# Altium schematic sheet Core.SchDoc
size A; SheetNumber: 1; SheetTotal: 3
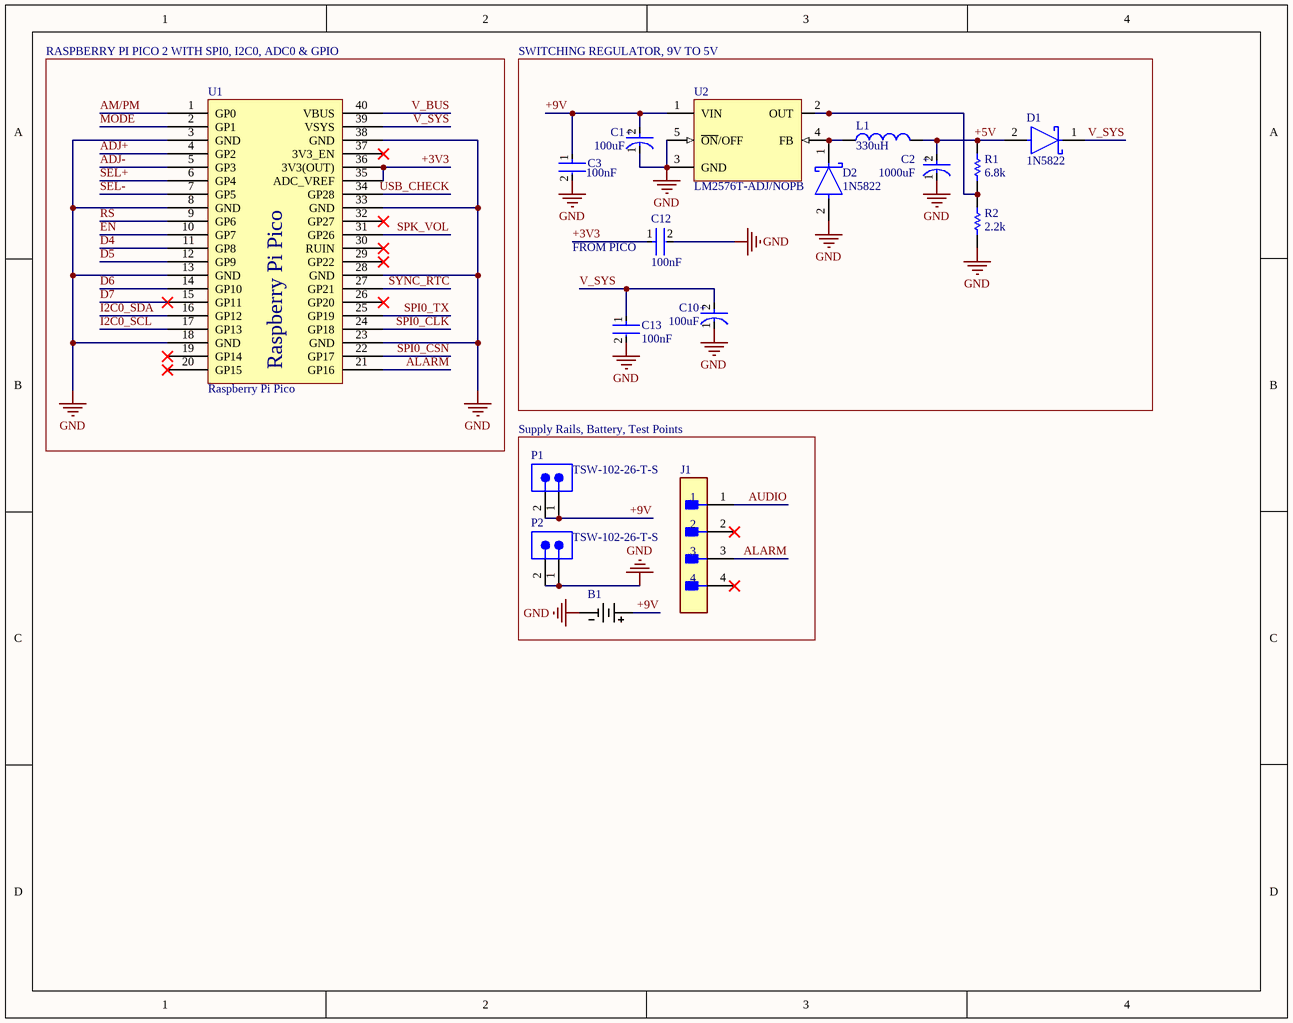
[diagram p0: Core.SchDoc]

## Parts
B1  BC9VPC  [BC9VPC_MPD]  (value not drawn)
C1  Capacitance: 100uF  [FP-RAD-TH-D_6_3_0_5-L_11-MFG]  (hidden comment: EEUFM1E101B)
C2  value 1000uF  [FP-RAD-TH-D_12_5_0_5-L_20-MFG]  (hidden comment: EEUFP1V102B)
C3  Capacitance: 100nF  [FP-RDE3M1-MFG]  (hidden comment: RDED72W104K3K1H03B)
C10  Capacitance: 100uF  [FP-RAD-TH-D_6_3_0_5-L_11-MFG]  (hidden comment: EEUFM1E101B)
C12  Capacitance: 100nF  [FP-RDE3M1-MFG]  (hidden comment: RDED72W104K3K1H03B)
C13  Capacitance: 100nF  [FP-RDE3M1-MFG]  (hidden comment: RDED72W104K3K1H03B)
D1  1N5822  [FP-DO-201AD-MFG]
D2  1N5822  [FP-DO-201AD-MFG]
J1  TSW-104-23-T-S  [FP-TSW-104-23-T-S-MFG]  (value not drawn)
L1  value 330uH  [SPD73R-334M]  (hidden comment: Inductor)
P1  TSW-102-26-T-S  [SMTC-TSW-102-26-XX-S]
P2  TSW-102-26-T-S  [SMTC-TSW-102-26-XX-S]
R1  Resistance: 6.8k  [RESA60-630X240]  (hidden comment: MFR-25FBF52-1M)
R2  Resistance: 2.2k  [RESA60-630X240]  (hidden comment: MFR-25FBF52-1M)
U1  Raspberry Pi Pico  [Raspberry Pi Pico]
U2  LM2576T-ADJ/NOPB  [KC0005A]

## Blocks framed on the sheet
RASPBERRY PI PICO 2 WITH SPI0, I2C0, ADC0 & GPIO: U1
Supply Rails, Battery, Test Points: B1 J1 P1 P2

## Nets
GND: B1.2 C1.1(C) C2.1(C) C3.2 C10.1(C) C12.2 C13.2 D2.2(A) P2.1 P2.2 R2.1 U1.3(GND) U1.8(GND) U1.13(GND) U1.18(GND) U1.23(GND) U1.28(GND) U1.33(GND) U1.38(GND) U2.3(GND) U2.5(~{ON}/OFF)
+3V3: C12.1 U1.35(ADC_VREF) U1.36(3V3(OUT))
+5V: C2.2(A) D1.2(A) L1.2 R1.2
+9V: B1.1 C1.2(A) C3.1 P1.1 P1.2 U2.1(VIN)
ADJ+: U1.4(GP2)
ADJ-: U1.5(GP3)
ALARM: J1.3 U1.21(GP16)
AM/PM: U1.1(GP0)
AUDIO: J1.1
D4: U1.11(GP8)
D5: U1.12(GP9)
D6: U1.14(GP10)
D7: U1.15(GP11)
EN: U1.10(GP7)
I2C0_SCL: U1.17(GP13)
I2C0_SDA: U1.16(GP12)
MODE: U1.2(GP1)
RS: U1.9(GP6)
SEL+: U1.6(GP4)
SEL-: U1.7(GP5)
SPI0_CLK: U1.24(GP18)
SPI0_CSN: U1.22(GP17)
SPI0_TX: U1.25(GP19)
SPK_VOL: U1.31(GP26)
SYNC_RTC: U1.27(GP21)
USB_CHECK: U1.34(GP28)
V_BUS: U1.40(VBUS)
V_SYS: C10.2(A) C13.1 D1.1(C) U1.39(VSYS)
NetD2_1: D2.1(C) L1.1 U2.4(FB)
NetR1_1: R1.1 R2.2 U2.2(OUT)

Not connected (* = marked no-connect by the designer): J1 2* 4*; U1 19(GP14)* 20(GP15)* 26(GP20)* 29(GP22)* 30(RUIN)* 32(GP27)* 37(3V3_EN)*

## Notes on the sheet
- SWITCHING REGULATOR, 9V TO 5V
- (near C12) FROM PICO
- (in symbol CMP-05427-000856-1) +
- (in symbol CMP-05427-001378-1) +

## Library data of the parts
B1 = BC9VPC: Description; Manufacturer_Name: Memory Protection Devices; Copyright: Copyright (C) 2026 Ultra Librarian. All rights reserved.; Manufacturer_Part_Number: BC9VPC
C1 C10 = CMP-05427-000856-1: Aluminum Electrolytic Capacitors (Radial Lead Type) 100uF ±20% 25V; Lead Diameter: 0.5mm; Polarity: Polar; Ripple Current: 455mA; Impedance: 130mR; Life (Hours): 2000Hour; Length: 11mm; Min Operating Temperature: -40°C; Termination: Radial; Diameter: 6mm; Lead Pitch: 5mm; Tolerance: 20%; Case/Package: Radial; Voltage Rating (DC): 25V; Height - Seated (Max): 0.5inch; RoHS Compliant: Yes; Series: FM; Package Quantity: 2000; Voltage Rating: 25V; Max Operating Temperature: 105°C; Mount: Through Hole; ESR (Equivalent Series Resistance): 130mR; Packaging: Tape and Reel
C2 = CMP-05427-001378-1: Aluminum Electrolytic Capacitors (Radial Lead Type) AEC-Q200 Qualified 1000uF ±20% 35V; RoHS Compliant: Yes
C3 C12 C13 = CMP-06035-016817-1: Ceramic Capacitor 100nF ±10% 450V X7T Radial; Tolerance: 10%; Voltage Rating: 450V; Lead Pitch: 5mm; Max Operating Temperature: 125°C; Voltage Rating (DC): 450V; Case/Package: Radial; Dielectric: X7T; Min Operating Temperature: -55°C; REACH SVHC: No SVHC
D1 D2 = CMP-12187-000025-1: DIODE SCHOTTKY 40V 3A DO201AD; Manufacturer: STMicroelectronics; Max Junction Temp: +150°C; Peak Reverse Current: 2mA; Max Surge Forward Current: 80A; Temperature Range High: +150°C; Automotive: No; RoHS: TRUE; ComponentLink2Description: Datasheet; Manufacturer Part Number: 1N5822; Lead Free: Yes; Octopart: https://octopart.com/1n5822-stmicroelectronics-323225; Device Class L2: Diodes; Max Repetitive Reverse Voltage: 40V; Temperature: to +150°C; Height: 5.3mm; Category: Diode; Digikey Description: DIODE SCHOTTKY 40V 3A DO201AD; ComponentLink2URL: https://www.st.com/resource/en/datasheet/1n5822.pdf; Device Class L3: Schottky Diodes; Device Class L1: Discrete Semiconductors; Forward Current: 3A; Mouser Description: Schottky Diodes & Rectifiers Vr/40V Io/3A BULK; Package: DO-201AD
J1 = CMP-02766-001388-1: CONN HEADER VERT 4POS 2.54MM; Number of Contacts: 4; Gender: Male; Connector Type: Male Pin; Max Voltage Rating (AC): 550V; Max Current Rating: 7.6A; Radiation Hardening: No; Lead Free: Lead Free; RoHS Compliant: Yes; Contact Material: Bronze; Number of Positions: 4; Housing Color: Black; Min Operating Temperature: -55°C; Mount: Through Hole; Number of Rows: 1; Orientation: Straight; Contact Mating Length: 0.23inch; Contact Type: Male Pin; REACH SVHC: No SVHC; Max Operating Temperature: 105°C; Color: Black; Pitch: 2.54mm; Length: 10.16mm; Series: TSW; Packaging: Bulk; Contact Plating: Tin; Package Quantity: 1; Termination: Solder; Housing Material: Polyester; Width: 2.54mm; Depth: 2.54mm
L1 = Inductor: Code_IEC: 1005; Published: 8-Jun-2000; LatestRevisionDate: 29-May-2009; LatestRevisionNote: IPC-7351 Footprint Added.; PackageReference: 0402-A; Publisher: Altium Limited; PackageDescription: Chip Inductor; Code_JEITA: 0402
P1 P2 = CMP-1024-00328-1: 0.025" SQ Post Header, Through-hole, Vertical, -55 to 105 degC, 2.54 mm Pitch, 2-Pin, Male, RoHS; Manufacturer: Samtec; Pitch: 2.54 mm; PackageReference: TSW-102-26-XX-S; ComponentLink1URL: http://www.samtec.com; ComponentLink3Description: Package Specification; ComponentLink3URL: http://www.samtec.com/documents/webfiles/cpdf/TSW-XXX-XX-XXX-X-XX-XXX-MKT.pdf; DatasheetVersion: F-214; ComponentLink2URL: http://www.samtec.com/documents/webfiles/pdf/TSW_TH.PDF; Mounting Technology: Through-hole; ComponentLink2Description: Datasheet; PartNumber: TSW-102-26-T-S; ComponentLink1Description: Manufacturer URL; PackageDescription: .025[0.64] SQ. Post Terminal Strip Assembly; Orientation: Vertical; PackageVersion: DM, 8/1988; Temperature Range: -55 to 105 degC; RoHS: True
R1 R2 = CMP-1659-00070-1: Axial Resistor, 1 MOhm, +/- 1%, 250 mW, -55 to 155 degC, 2-Pin THD, RoHS, Bulk; Power Rating: 250 mW; Voltage Rating: 250 V; ComponentLink1Description: Manufacturer URL; PackageReference: MFR-25; ComponentLink2Description: Datasheet; ComponentLink2URL: http://www.yageo.com/documents/recent/Yageo%20LR_MFR_2013.pdf; Tolerance: 1%; DatasheetVersion: Apr-13; Package Quantity: 200; Packaging: Bulk; Case\Package: Axial; RoHSCompliant: true; ComponentLink1URL: http://www.yageo.com/; Length: 0.248 inch; Min Operating Temperature: -55 degC; Mount: Through Hole; PackageDescription: 2-Pin Axial Lead, Dia 2.4 mm, Body Length 6.3 mm; Max Operating Temperature: 155 degC
U2 = CMP-0069-02005-3: SIMPLE SWITCHER® 3A Step-Down Voltage Regulator, 5-pin TO-220, Pb-Free; Manufacturer: Texas Instruments; PowerWise: N; PackageTopMarking: NSUZXYTTE#*LM2576T*-ADJ P+; CompType: Switcher; PinCount: 5; PackageReference: KC0005A; RoHS: Y; Code_JEDEC: TO-220-AB; ComponentLink1URL: http://www.ti.com/general/docs/lit/getliterature.tsp?genericPartNumber=LM2576&fileType=pdf; ComponentLink1Description: Datasheet URL; PackageDescription: TO-220, Molded, 5 Lead, Straight